# Altium schematic sheet signal-light-4.SchDoc
size A4; SheetNumber: 7; SheetTotal: 21
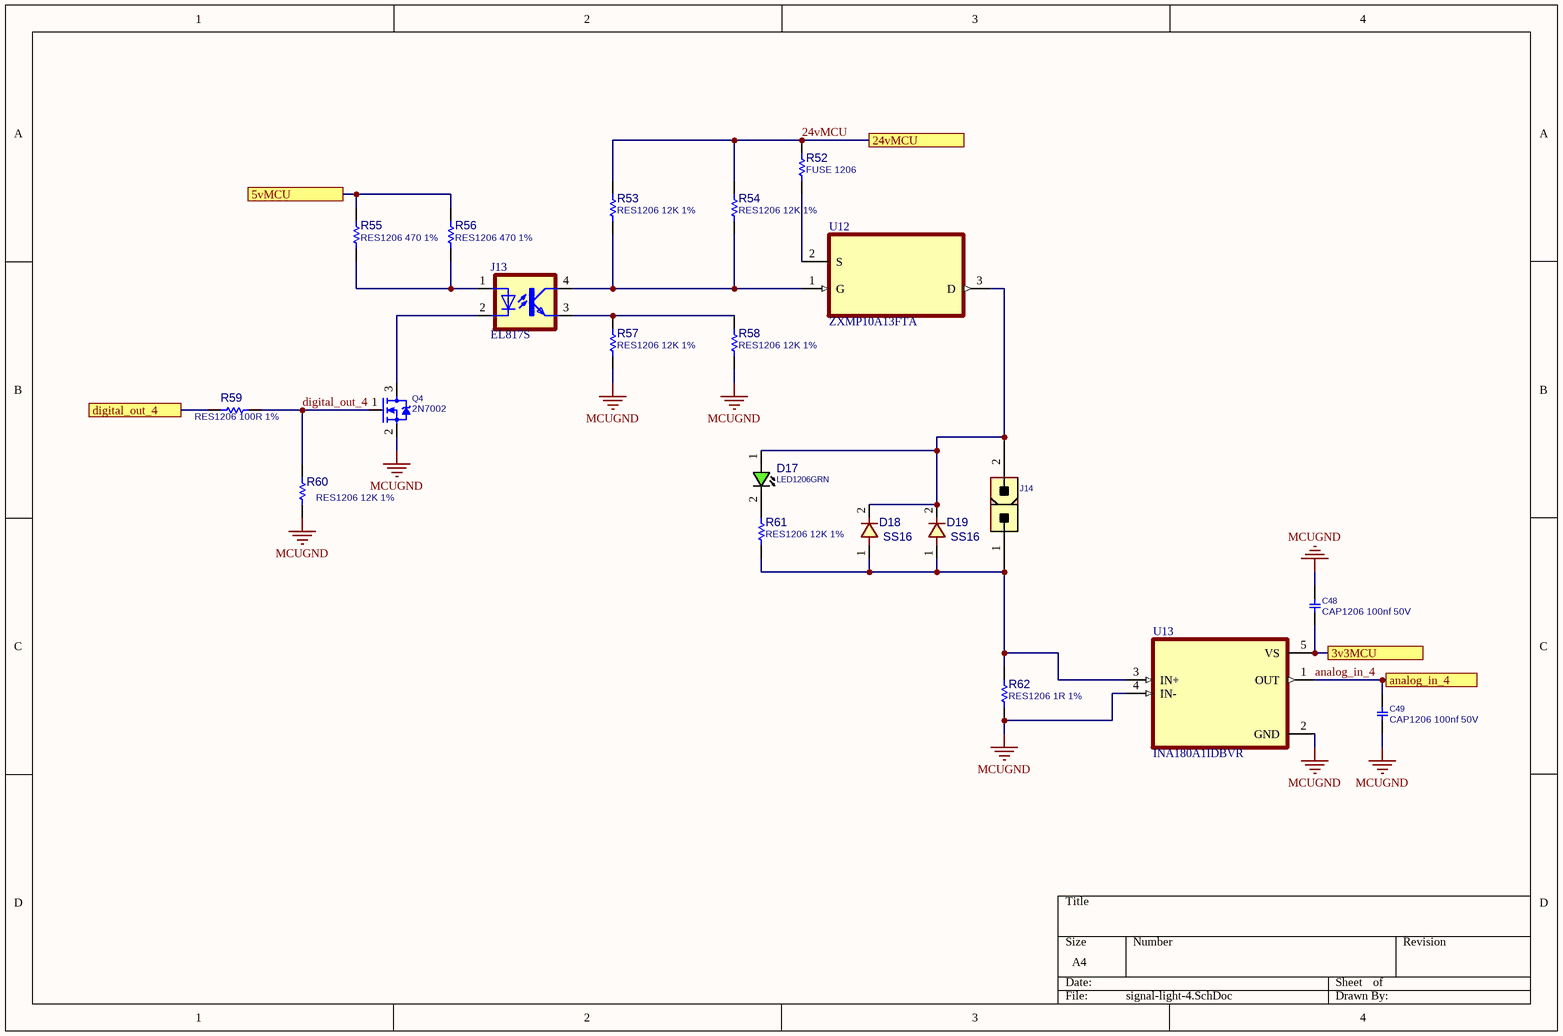
[diagram p0: signal-light-4.SchDoc]

## Parts
C48  CAP1206 100nf 50V  [C1206]
C49  CAP1206 100nf 50V  [C1206]
D17  LED1206GRN  [LED1206GRN]
D18  SS16  [D_SMA]
D19  SS16  [D_SMA]
J13  EL817S  [SOIC254P1030X460-4N]
J14  CONN_ATXPWR_2  [ATXPWR_2]  (value not drawn)
Q4  2N7002  [SOT23_3]
R52  FUSE 1206  [R1206]
R53  RES1206 12K 1%  [R1206]
R54  RES1206 12K 1%  [R1206]
R55  RES1206 470 1%  [R1206]
R56  RES1206 470 1%  [R1206]
R57  RES1206 12K 1%  [R1206]
R58  RES1206 12K 1%  [R1206]
R59  RES1206 100R 1%  [R1206]
R60  RES1206 12K 1%  [R1206]
R61  RES1206 12K 1%  [R1206]
R62  RES1206 1R 1%  [R1206]
U12  ZXMP10A13FTA  [SOT95P230X110-3N]
U13  INA180A1IDBVR  [SOT95P280X145-5N]

## Ports
3v3MCU, 5vMCU, 24vMCU, analog_in_4, digital_out_4

## Nets
MCUGND: C48.1 C49.2 Q4.2(SOURCE) R57.2 R58.2 R60.2 R62.2 U13.2(GND) U13.4(IN-)
3v3MCU: C48.2 U13.5(VS) ; port 3v3MCU
5vMCU: R55.2 R56.2 ; port 5vMCU
24vMCU: R52.1 R53.1 R54.1 ; port 24vMCU
analog_in_4: C49.1 U13.1(OUT) ; port analog_in_4
digital_out_4: Q4.1(GATE) R59.2 R60.1
digital_out_4: R59.1 ; port digital_out_4  [a separate net that carries the same name]
NetD17_1: D17.1(ANODE) D18.2 D19.2 J14.2 U12.3(D)
NetD17_2: D17.2(CATHODE) R61.1
NetD18_1: D18.1 D19.1 J14.1 R61.2 R62.1 U13.3(IN+)
NetJ13_1: J13.1(A) R55.1 R56.1
NetJ13_2: J13.2(C) Q4.3(DRAIN)
NetJ13_3: J13.3(EMIT) R57.1 R58.1
NetJ13_4: J13.4(COL) R53.2 R54.2 U12.1(G)
NetR52_2: R52.2 U12.2(S)

## Library data of the parts
C48 C49 = CAP_SMD_MLCC_1206: CAP, MLCC; PARAM: -, -%; MANF_P#: MANF_PART#; PARAM2: -V; PRICE: 100= 1$; MANF: -; ASSEMBLY: ASSEMBLY
D17 = LED_SMD_1206_GRN: LED, SMD, 1206, GREEN; PARAM: 20mA; DESC: DESCRIPTION; PARAM2: 2.2V; MANF: -; ASSEMBLY: ASSEMBLY; PRICE: 36t@Javan; MANF_P#: -; VALUE: LED1206GRN; MountType: SMT; PartType: LED
D18 D19 = DIODE_SMD_1N4001: DIODE, GENERAL PURPOSE, 50V/1A; DESC: DESCRIPTION; PARAM: 50V VRRM; PARAM2: 1A; MANF_P#: 1N4001; MANF: MANF; ASSEMBLY: ASSEMBLY; PRICE: PRICE; VALUE: SS16
J13 = EL817S: Optoisolator Transistor Output 5000Vrms 1 Channel 4-SMD; MF: Everlight Electronics; SnapEDA_Link: https://www.snapeda.com/parts/EL817S/Everlight+Electronics+Co+Ltd/view-part/?ref=snap; Package: SMD-4 Everlight Electronics Co Ltd; Value: *; MP: EL817S; Check_prices: https://www.snapeda.com/parts/EL817S/Everlight+Electronics+Co+Ltd/view-part/?ref=eda
J14 = CONN_ATXPWR_2: CONN, ATX POWER, 2 P; MANF: Molex; MANF_P#: 39281023; VALUE: CONN_ATXPWR_2; MountType: THD; PACKAGE: ATXPWR-2pin; Part Type: Conn.
Q4 = MOSN_2N7002_SOT23: MOSFET, N-CH, 60V, 0.3A; MANF: NXP; ASSEMBLY: ASSEMBLY; MANF_P#: 2N7002; PARAM2: 60v; PARAM: 0.3A; PRICE: 0.3t@Javan; VALUE: 2N7002
R52-R62 = RES_SMD_1206: RESISTOR, SMD; PARAM: 1%, 0.25W; DESC: DESCRIPTION; DIST#: MOUSER; MANF_P#: -; MANF: -; ASSEMBLY: ASSEMBLY; PRICE: -; PARAM2: -
U12 = ZXMP10A13FTA: P-Channel 100 V 600mA (Ta) 625mW (Ta) Surface Mount SOT-23-3; MF: Diodes Inc.; Purchase-URL: https://pricing.snapeda.com/search/part/ZXMP10A13FTA/?ref=eda; Package: SOT-23-3 Diodes Inc.; SnapEDA_Link: https://www.snapeda.com/parts/ZXMP10A13FTA/Diodes+Inc./view-part/?ref=snap; Availability: In Stock; Value: *; MP: ZXMP10A13FTA; Check_prices: https://www.snapeda.com/parts/ZXMP10A13FTA/Diodes+Inc./view-part/?ref=eda; Price: None
U13 = INA180A1IDBVR: 26V, 350kHz current sense amplifier; MF: Texas Instruments; SnapEDA_Link: https://www.snapeda.com/parts/INA180A1IDBVR/Texas+Instruments/view-part/?ref=snap; Package: SOT-23-5 Texas Instruments; Value: *; MP: INA180A1IDBVR; Check_prices: https://www.snapeda.com/parts/INA180A1IDBVR/Texas+Instruments/view-part/?ref=eda